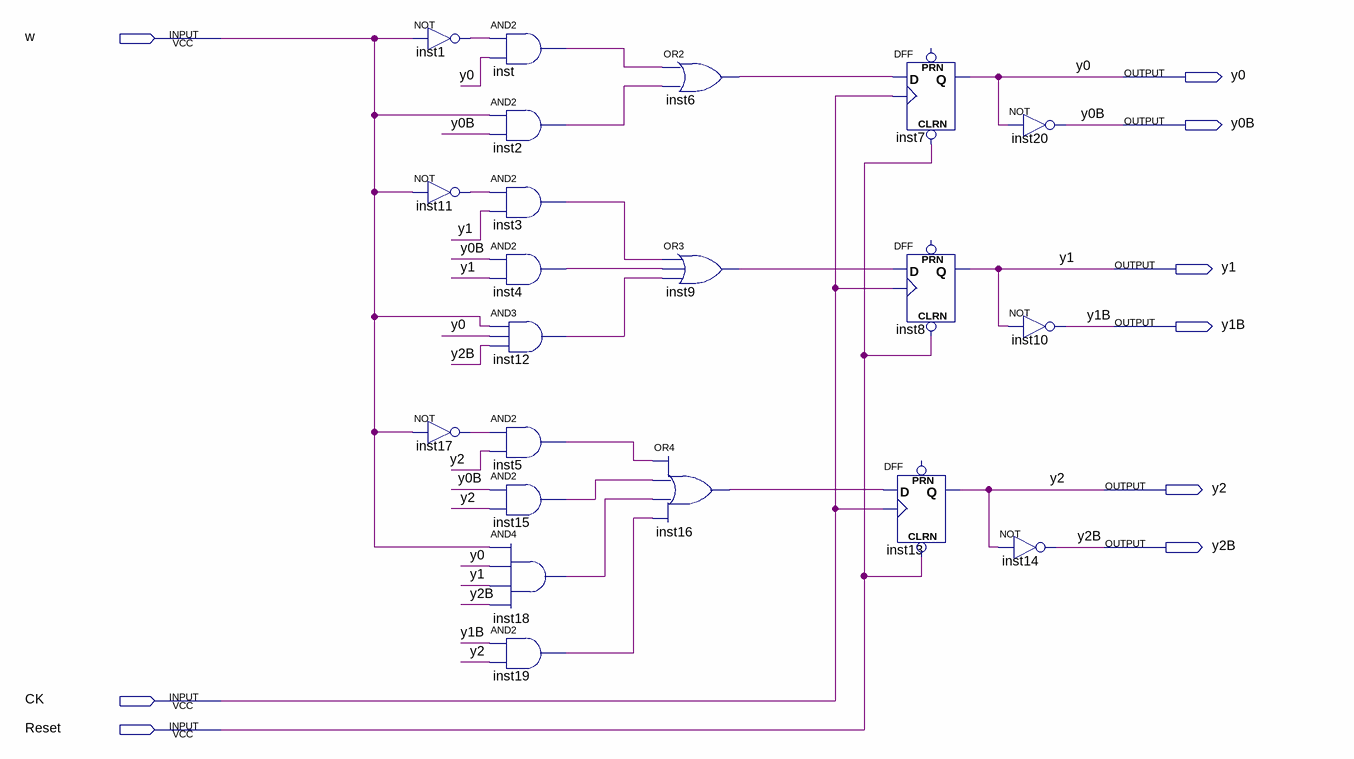
[diagram p0: schematic sheet]
// Quartus schematic FPGA_Dice.bdf as structural Verilog: 21 symbols, 9 pins
module FPGA_Dice (
  input  w,
  input  CK,
  input  Reset,
  output y0,
  output y0B,
  output y1,
  output y1B,
  output y2,
  output y2B
);

  wire inst1_out, inst2_out, inst3_out, inst4_out, inst5_out, inst6_out, inst9_out, inst11_out, inst12_out,
       inst15_out, inst16_out, inst17_out, inst18_out, inst19_out, inst_out;

  not inst1 (inst1_out, w);
  not inst11 (inst11_out, w);
  not inst17 (inst17_out, w);
  and inst (inst_out, inst1_out, y0);
  and inst2 (inst2_out, w, y0B);
  and inst3 (inst3_out, inst11_out, y1);
  and inst4 (inst4_out, y0B, y1);
  and inst12 (inst12_out, w, y0, y2B);
  and inst5 (inst5_out, inst17_out, y2);
  and inst15 (inst15_out, y0B, y2);
  and inst18 (inst18_out, w, y0, y1, y2B);
  and inst19 (inst19_out, y1B, y2);
  or inst6 (inst6_out, inst_out, inst2_out);
  or inst9 (inst9_out, inst3_out, inst4_out, inst12_out);
  or inst16 (inst16_out, inst5_out, inst15_out, inst18_out, inst19_out);
  DFF inst7 (.CLRN(Reset), .CLK(CK), .D(inst6_out), .Q(y0));  // open: PRN
  DFF inst8 (.CLRN(Reset), .CLK(CK), .D(inst9_out), .Q(y1));  // open: PRN
  DFF inst13 (.CLRN(Reset), .CLK(CK), .D(inst16_out), .Q(y2));  // open: PRN
  not inst20 (y0B, y0);
  not inst10 (y1B, y1);
  not inst14 (y2B, y2);
endmodule
